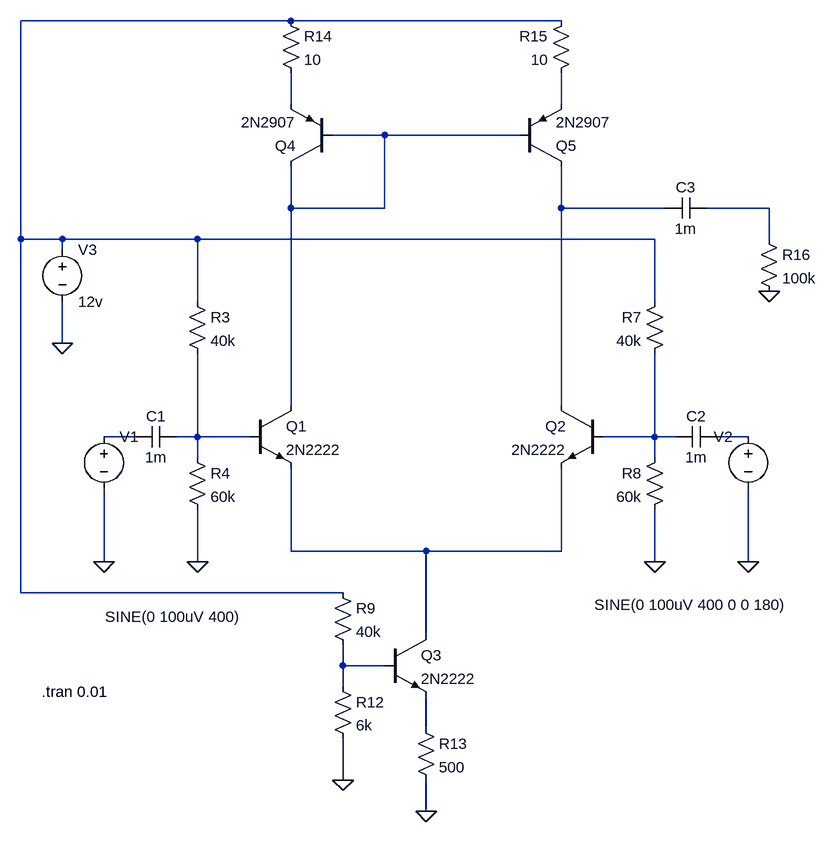
[diagram p0: schematic 07 AD_4_cu_oglinda_de_curent_iesire_in_curent.asc]
07 AD_4_cu_oglinda_de_curent_iesire_in_curent.asc, the LTspice schematic file:
Version 4
SHEET 1 916 724
WIRE 96 -512 -320 -512
WIRE 512 -512 96 -512
WIRE 96 -384 96 -432
WIRE 512 -384 512 -432
WIRE 240 -336 160 -336
WIRE 448 -336 240 -336
WIRE 96 -224 96 -288
WIRE 240 -224 240 -336
WIRE 240 -224 96 -224
WIRE 512 -224 512 -288
WIRE 672 -224 512 -224
WIRE 832 -224 736 -224
WIRE -320 -176 -320 -512
WIRE -256 -176 -320 -176
WIRE -48 -176 -256 -176
WIRE 656 -176 -48 -176
WIRE 832 -176 832 -224
WIRE -256 -160 -256 -176
WIRE -48 -80 -48 -176
WIRE 656 -80 656 -176
WIRE -256 -16 -256 -80
WIRE 96 80 96 -224
WIRE 512 80 512 -224
WIRE -144 128 -192 128
WIRE -48 128 -48 0
WIRE -48 128 -80 128
WIRE 32 128 -48 128
WIRE 656 128 656 0
WIRE 656 128 576 128
WIRE 688 128 656 128
WIRE 800 128 752 128
WIRE -48 160 -48 128
WIRE 656 160 656 128
WIRE 96 304 96 176
WIRE 304 304 96 304
WIRE 512 304 512 176
WIRE 512 304 304 304
WIRE -192 320 -192 208
WIRE -48 320 -48 240
WIRE 656 320 656 240
WIRE 800 320 800 208
WIRE -320 368 -320 -176
WIRE 176 368 -320 368
WIRE 304 432 304 304
WIRE 176 480 176 448
WIRE 240 480 176 480
WIRE 176 512 176 480
WIRE 304 576 304 528
WIRE 176 656 176 592
WIRE 304 704 304 656
FLAG -48 320 0
FLAG -192 320 0
FLAG 656 320 0
FLAG 800 320 0
FLAG -256 -16 0
FLAG 176 656 0
FLAG 304 704 0
FLAG 832 -96 0
SYMBOL npn 32 80 R0
SYMATTR InstName Q1
SYMATTR Value 2N2222
SYMBOL res -64 -96 R0
SYMATTR InstName R3
SYMATTR Value 40k
SYMBOL res -64 144 R0
SYMATTR InstName R4
SYMATTR Value 60k
SYMBOL cap -80 112 R90
WINDOW 0 0 32 VBottom 2
WINDOW 3 32 32 VTop 2
SYMATTR InstName C1
SYMATTR Value 1m
SYMBOL voltage -192 112 R0
WINDOW 123 0 0 Left 2
WINDOW 39 0 0 Left 2
WINDOW 3 2 293 Left 2
SYMATTR Value SINE(0 100uV 400)
SYMATTR InstName V1
SYMBOL npn 576 80 M0
SYMATTR InstName Q2
SYMATTR Value 2N2222
SYMBOL res 672 -96 M0
SYMATTR InstName R7
SYMATTR Value 40k
SYMBOL res 672 144 M0
SYMATTR InstName R8
SYMATTR Value 60k
SYMBOL cap 688 112 M90
WINDOW 0 0 32 VBottom 2
WINDOW 3 32 32 VTop 2
SYMATTR InstName C2
SYMATTR Value 1m
SYMBOL voltage 800 112 M0
WINDOW 123 0 0 Left 2
WINDOW 39 0 0 Left 2
WINDOW 3 -60 274 Left 2
SYMATTR Value SINE(0 100uV 400 0 0 180)
SYMATTR InstName V2
SYMBOL voltage -256 -176 R0
WINDOW 123 0 0 Left 2
WINDOW 39 0 0 Left 2
SYMATTR InstName V3
SYMATTR Value 12v
SYMBOL npn 240 432 R0
SYMATTR InstName Q3
SYMATTR Value 2N2222
SYMBOL res 160 352 R0
SYMATTR InstName R9
SYMATTR Value 40k
SYMBOL res 160 496 R0
SYMATTR InstName R12
SYMATTR Value 6k
SYMBOL res 288 560 R0
SYMATTR InstName R13
SYMATTR Value 500
SYMBOL pnp 160 -288 R180
SYMATTR InstName Q4
SYMATTR Value 2N2907
SYMBOL res 80 -528 R0
SYMATTR InstName R14
SYMATTR Value 10
SYMBOL pnp 448 -288 M180
SYMATTR InstName Q5
SYMATTR Value 2N2907
SYMBOL res 528 -528 M0
SYMATTR InstName R15
SYMATTR Value 10
SYMBOL res 816 -192 R0
SYMATTR InstName R16
SYMATTR Value 100k
SYMBOL cap 736 -240 R90
WINDOW 0 0 32 VBottom 2
WINDOW 3 32 32 VTop 2
SYMATTR InstName C3
SYMATTR Value 1m
TEXT -288 520 Left 2 !.tran 0.01

The netlist it stands for:
* 07 AD_4_cu_oglinda_de_curent_iesire_in_curent.asc
Q1 N004 N008 N011 0 2N2222
R3 N001 N008 40k
R4 N008 0 60k
C1 N008 N007 1m
V1 N007 0 SINE(0 100uV 400)
Q2 N005 N009 N011 0 2N2222
R7 N001 N009 40k
R8 N009 0 60k
C2 N009 N010 1m
V2 N010 0 SINE(0 100uV 400 0 0 180)
V3 N001 0 12v
Q3 N011 N012 N013 0 2N2222
R9 N001 N012 40k
R12 N012 0 6k
R13 N013 0 500
Q4 N004 N004 N002 0 2N2907
R14 N001 N002 10
Q5 N005 N004 N003 0 2N2907
R15 N001 N003 10
R16 N006 0 100k
C3 N006 N005 1m
.model NPN NPN
.model PNP PNP
.lib standard.bjt
.tran 0.01
.backanno
.end